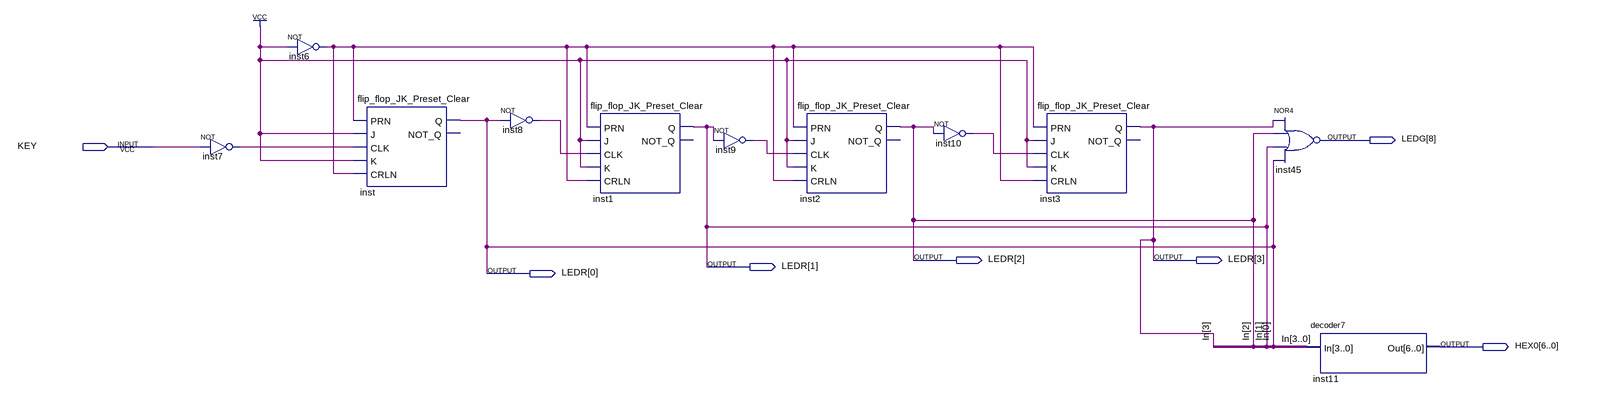
[diagram p0: schematic sheet]
// Quartus schematic exp8_2-2.bdf as structural Verilog: 11 symbols, 7 pins
module \exp8_2-2  (
  input  KEY,
  output [8:8] LEDG,
  output [3:0] LEDR,
  output [6:0] HEX0
);

  wire inst6_out, inst7_out, inst8_out, inst9_out, inst10_out;

  not inst7 (inst7_out, KEY);
  not inst6 (inst6_out, 1'b1);
  flip_flop_JK_Preset_Clear inst (
    .PRN(inst6_out), .J(1'b1), .CLK(inst7_out), .K(1'b1), .CRLN(inst6_out), .Q(LEDR[0]));  // open: NOT_Q
  not inst8 (inst8_out, LEDR[0]);
  flip_flop_JK_Preset_Clear inst1 (
    .PRN(inst6_out), .J(1'b1), .CLK(inst8_out), .K(1'b1), .CRLN(inst6_out), .Q(LEDR[1]));  // open: NOT_Q
  not inst9 (inst9_out, LEDR[1]);
  flip_flop_JK_Preset_Clear inst2 (
    .PRN(inst6_out), .J(1'b1), .CLK(inst9_out), .K(1'b1), .CRLN(inst6_out), .Q(LEDR[2]));  // open: NOT_Q
  not inst10 (inst10_out, LEDR[2]);
  flip_flop_JK_Preset_Clear inst3 (
    .PRN(inst6_out), .J(1'b1), .CLK(inst10_out), .K(1'b1), .CRLN(inst6_out), .Q(LEDR[3]));  // open: NOT_Q
  nor inst45 (LEDG[8], LEDR[3], LEDR[2], LEDR[1], LEDR[0]);
  decoder7 inst11 (.In(LEDR), .Out(HEX0));

  // Other names for the same wires on the sheet: In[3:0] = LEDR
endmodule
